# EasyEDA Pro project Orion S4 PCB.epro

# Board PCB1
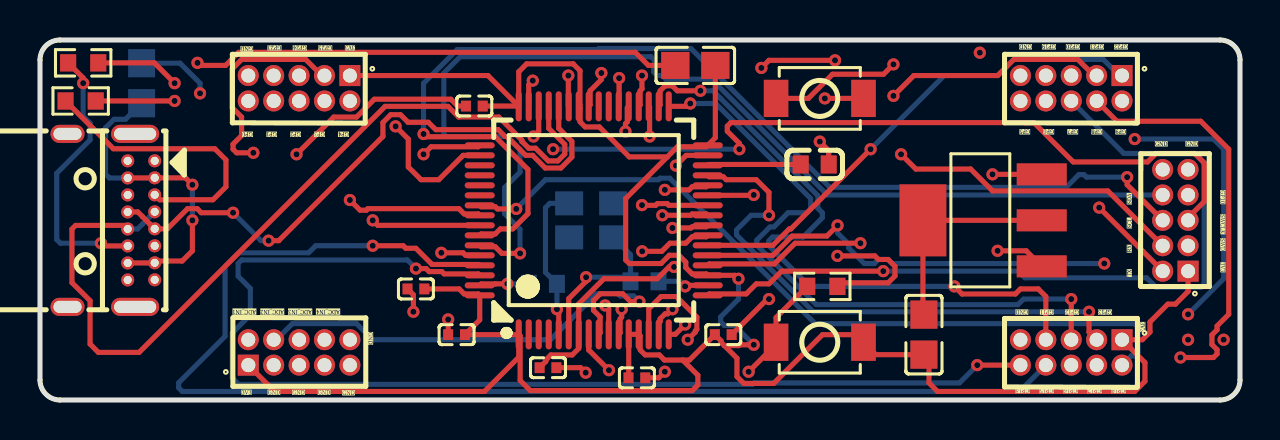
[diagram p0: board, top side]
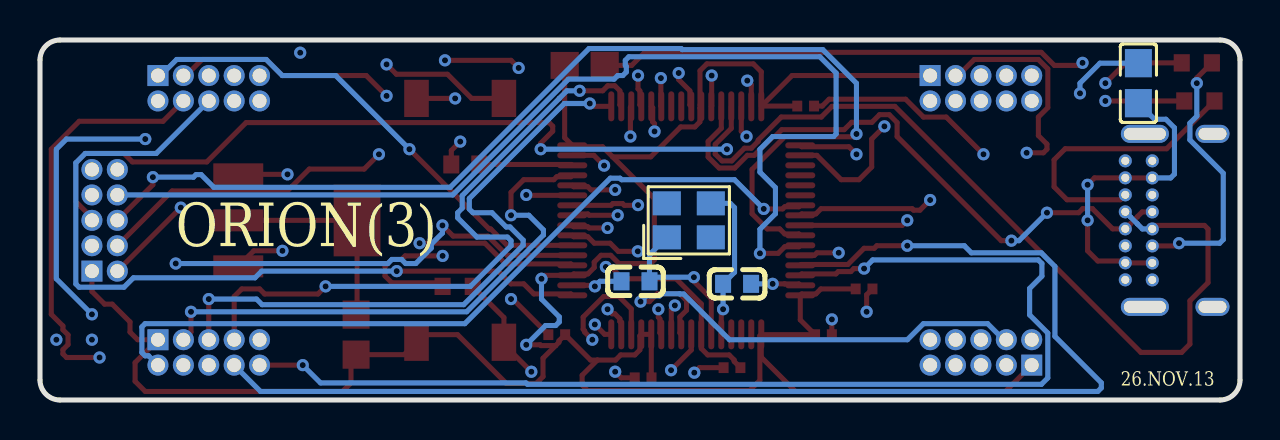
[diagram p1: board, bottom side, seen from below]

Outline 60 x 18 mm; copper layers: Top Layer, Inner1, Inner2, Inner3, Inner4, Bottom Layer. Coordinates in mm from the lower left corner of the outline.
Outline path: 0,17 0,1 arc(0.29,0.29) 1,0 59,0 arc(59.71,0.29) 60,1 60,17 arc(59.71,17.71) 59,18 1,18 arc(0.29,17.71) 0,17
Stack: Top Layer 0.035mm Outer layer thickness 1oz / Dielectric1 0.0994mm 3313 RC57% 4.2mil / Inner1 0.0152mm Inner layer thickness / Dielectric2 0.55mm 0.55mm H/H No copper / Inner2 0.0152mm Inner layer thickness / Dielectric3 0.1088mm 2116 RC54% 4.9mil / Inner3 0.0152mm Inner layer thickness / Dielectric4 0.55mm 0.55mm H/H No copper / Inner4 0.0152mm Inner layer thickness / Dielectric5 0.0994mm 3313 RC57% 4.2mil / Bottom Layer 0.035mm Outer layer thickness 1oz

## Design rules (mm)
spacing copperThickness1oz (default): track to track 0.102, other pairs 0.152 to 0.3
spacing copperThickness2oz: track to track 0.203, other pairs 0.152 to 0.3
track width copperThickness1oz (default): min 0.127, default 0.254, max 2.54
track width copperThickness2oz: min 0.203, default 0.254, max 2.54
differential pair differentialPair (default): width min 0.127, default 0.254, max 2.54; gap min 0.152, default 0.152
net GND uses copperRegion

## Placement (name value [footprint] x y rotation side)
C1  22pF  [C0603]  25.15 5.81 0 bottom
C2  22pF  [C0603]  30.23 5.94 180 bottom
C3  4.7nF  [C0603]  38.74 11.78 180 top
C4  100nF  [C0805]  32.77 16.73 180 top
C5  100nF  [C0402]  29.84 1.11 0 top
C6  100nF  [C0402]  21.72 14.7 0 top
C7  100nF  [C0402]  18.8 5.55 0 top
C8  100nF  [C0402]  34.16 3.27 180 top
C9  100nF  [C0402]  20.83 3.27 0 top
C10  10uF  [C0805]  5.08 15.84 270 bottom
C12  100nF  [C0402]  25.4 1.62 180 top
C14  10uF  [C0805]  44.2 3.27 270 top
R1  5.1kΩ  [R0603]  2.03 14.95 180 top
R2  5.1kΩ  [R0603]  2.16 16.86 0 top
R3  10kΩ  [R0603]  39.12 5.68 180 top
SW1  TS-1088-AR02016  [SW-SMD_L3.9-W3.0-P4.45]  38.99 2.89 0 top
SW2  TS-1088-AR02016  [SW-SMD_L3.9-W3.0-P4.45]  38.99 15.08 0 top
U1  STM32F401RET6  [LQFP-64_L10.0-W10.0-P0.50-LS12.0-BL]  27.69 8.98 0 top
U2  M50-3500542  [HDR-TH_10P-P1.27-V-M-R2-C5-S1.27-1]  51.56 15.59 180 top
U3  M50-3500542  [HDR-TH_10P-P1.27-V-M-R2-C5-S1.27-1]  12.95 15.59 180 top
U4  M50-3500542  [HDR-TH_10P-P1.27-V-M-R2-C5-S1.27-1]  12.95 2.38 0 top
U5  M50-3500542  [HDR-TH_10P-P1.27-V-M-R2-C5-S1.27-1]  56.77 8.98 90 top
U6  M50-3500542  [HDR-TH_10P-P1.27-V-M-R2-C5-S1.27-1]  51.56 2.38 180 top
U7  AMS1117-3.3  [SOT-223-3_L6.5-W3.4-P2.30-LS7.0-BR]  47.12 8.98 0 top
USB1  USB4085-GF-A  [USC-C-SMD_USB4085-GF-A]  3.56 8.98 270 top
X1  25MHz  [CRYSTAL-SMD_4P-L3.2-W2.5-BL]  27.56 8.98 180 bottom

## Footprints (pads in the part's own frame, mm; a bottom-side part is the same pattern mirrored in y, then rotated)
C0402
  rect 0.5x0.54 smd: 1(-0.42,0) 2(0.42,0)
C0603
  rect 0.8x0.9 smd: 1(-0.7,0) 2(0.7,0)
C0805
  rect 1.41x1.35 smd: 1(-1,0) 2(1,0)
CRYSTAL-SMD_4P-L3.2-W2.5-BL
  rect 1.4x1.2 smd: 1(-1.1,-0.85) 2(1.1,-0.85) 3(1.1,0.85) 4(-1.1,0.85)
HDR-TH_10P-P1.27-V-M-R2-C5-S1.27-1
  rect 1.05x1.05 hole 0.7: 1(-2.54,-0.635)
  round 1.05 hole 0.7: 2(-2.54,0.635) 3(-1.27,-0.635) 4(-1.27,0.635) 5(0,-0.635) 6(0,0.635) 7(1.27,-0.635) 8(1.27,0.635) 9(2.54,-0.635) 10(2.54,0.635)
LQFP-64_L10.0-W10.0-P0.50-LS12.0-BL
  oval 0.3x1.5 smd: 1(-3.75,-5.7) 2(-3.25,-5.7) 3(-2.75,-5.7) 4(-2.25,-5.7) 5(-1.75,-5.7) 6(-1.25,-5.7) 7(-0.75,-5.7) 8(-0.25,-5.7) 9(0.25,-5.7) 10(0.75,-5.7) 11(1.25,-5.7) 12(1.75,-5.7) 13(2.25,-5.7) 14(2.75,-5.7) 15(3.25,-5.7) 16(3.75,-5.7) 33(3.75,5.7) 34(3.25,5.7) 35(2.75,5.7) 36(2.25,5.7) 37(1.75,5.7) 38(1.25,5.7) 39(0.75,5.7) 40(0.25,5.7) 41(-0.25,5.7) 42(-0.75,5.7) 43(-1.25,5.7) 44(-1.75,5.7) 45(-2.25,5.7) 46(-2.75,5.7) 47(-3.25,5.7) 48(-3.75,5.7)
  oval 1.5x0.3 smd: 17(5.7,-3.75) 18(5.7,-3.25) 19(5.7,-2.75) 20(5.7,-2.25) 21(5.7,-1.75) 22(5.7,-1.25) 23(5.7,-0.75) 24(5.7,-0.25) 25(5.7,0.25) 26(5.7,0.75) 27(5.7,1.25) 28(5.7,1.75) 29(5.7,2.25) 30(5.7,2.75) 31(5.7,3.25) 32(5.7,3.75) 49(-5.7,3.75) 50(-5.7,3.25) 51(-5.7,2.75) 52(-5.7,2.25) 53(-5.7,1.75) 54(-5.7,1.25) 55(-5.7,0.75) 56(-5.7,0.25) 57(-5.7,-0.25) 58(-5.7,-0.75) 59(-5.7,-1.25) 60(-5.7,-1.75) 61(-5.7,-2.25) 62(-5.7,-2.75) 63(-5.7,-3.25) 64(-5.7,-3.75)
R0603
  rect 0.806x0.864 smd: 1(-0.753,0) 2(0.753,0)
SOT-223-3_L6.5-W3.4-P2.30-LS7.0-BR
  rect 2.5x1.1 smd: 1(2.97,-2.3) 2(2.97,0) 3(2.97,2.3)
  rect 2.34x3.6 smd: 4(-2.97,0)
SW-SMD_L3.9-W3.0-P4.45
  rect 1.23x1.86 smd: 1(-2.185,0) 2(2.185,0)
USC-C-SMD_USB4085-GF-A
  round 0.65 hole 0.4: A1(-2.975,2.18) A4(-2.125,2.18) A5(-1.275,2.18) A6(-0.425,2.18) A7(0.425,2.18) A8(1.275,2.18) A9(2.125,2.18) A12(2.975,2.18) B1(2.98,0.83) B4(2.13,0.83) B5(1.28,0.83) B6(0.43,0.83) B7(-0.42,0.83) B8(-1.27,0.83) B9(-2.12,0.83) B12(-2.975,0.83)
  oval 0.9x2.4 hole 0.6x2.1: S1(-4.325,1.2) S1(4.325,1.2)
  oval 0.9x1.7 hole 0.6x1.4: S1(-4.325,-2.18) S1(4.325,-2.18)

## Nets
3V3: C4.1 C5.1 C6.2 C7.2 C8.2 C9.2 C14.2 SW1.2 U1.1 U1.12 U1.13 U1.19 U1.32 U1.42 U1.48 U1.64 U3.1 U4.1 U5.1 U6.1
GND: C1.1 C2.1 C3.1 C4.2 C5.2 C6.1 C7.1 C8.1 C9.1 C10.1 C12.1 R1.1 R2.2 R3.1 SW2.1 U1.18 U1.31 U1.47 U1.63 U2.9 U3.9 U4.3 U4.5 U4.7 U4.9 U4.10 U5.9 U5.10 U6.9 U7.1 USB1.A1 USB1.A12 USB1.B1 USB1.B12 USB1.S1
VBUS: C10.2 U7.3 USB1.A4 USB1.A9 USB1.B4 USB1.B9
ADC1_IN1: U1.8 U4.2
ADC2_IN2: U1.9 U4.4
ADC3_IN3: U1.10 U4.6
ADC4_IN4: U1.11 U4.8
BOOT: R3.2 SW1.1 U1.60
CRYSTAL_IN: C1.2 U1.5 X1.3
CRYSTAL_OUT: C2.2 U1.6 X1.1
DN: U1.44 USB1.A7 USB1.B7
DP: U1.45 USB1.A6 USB1.B6
NRST: C12.2 SW2.2 U1.7
PA0: U1.14 U5.7
PA1: U1.15 U2.2
PA2: U1.16 U2.4
PA3: U1.17 U2.6
PA4: U1.20 U2.8
PA5: U1.21 U2.10
PA6: U1.22 U2.1
PA7: U1.23 U2.3
PA8: U1.41 U2.5
PA10: U1.43 U3.2
PA15: U1.50 U2.7
PB0: U1.26 U3.3
PB1: U1.27 U3.5
PB2: U1.28 U3.7
PB3: U1.55 U6.2
PB4: U1.56 U6.4
PB5: U1.57 U6.6
PB8: U1.61 U6.8
PB9: U1.62 U6.10
PB10: U1.29 U6.3
PB12: U1.33 U6.5
PB13: U1.34 U6.7
PB14: U1.35 U3.8
PB15: U1.36 U3.10
PC4: U1.24 U3.4
PC5: U1.25 U3.6
RX: U1.38 U5.4
SCL: U1.58 U5.6
SDA: U1.59 U5.8
SWCLK: U1.49 U5.5
SWD: U1.46 U5.3
TX: U1.37 U5.2
$1N19: R1.2 USB1.A5
$1N20: R2.1 USB1.B5
$1N166: C3.2 U1.30
$1N220: C14.1 U7.2 U7.4

Pads without a net: U1 2 3 4 39 40 51 52 53 54; USB1 A8 B8; X1 2 4

## Via types
v1: diameter 0.61, hole 0.305, Top Layer to Bottom Layer, 89 vias

## Routing (per net, layer and track width the routed paths; a pad name or vN(x,y) marks a point on that pad's centre or on a via; arc(x,y) is an arc through that point)
3V3: length 127.9
  Top Layer w0.254: C5.1 29.44,1.12 U1.12 U1.13 30.01,3.21 30.01,2.51 30.26,2.25 30.97,2.25 31.22,2 32.13,2 ; 32.13,2 32.89,1.24 32.89,0.75 32.62,0.47 24.51,0.47 24.01,0.98 24.01,3.21 U1.1 ; 32.13,2 32.47,2 33.74,3.27 34.05,2.96 34.05,2.88 34.22,2.72 ; U1.1 23.94,2.14 22.22,0.43 11.73,0.43 U4.1 ; U1.1 23.92,3.27 C9.2 21.99,4.01 U1.64 21.91,5.3 21.21,5.3 20.96,5.55 C7.2 ; 31.37,12.16 29.28,10.07 29.28,7 29.46,6.82 31.05,6.82 31.46,7.24 31.95,7.24 32.29,6.89 32.29,6.62 32.61,6.3 33.31,6.3 U1.19 34.75,6.23 v1(34.93,6.06) ; 31.37,12.16 29.46,12.16 27.97,13.65 27.26,13.65 27.01,13.91 27.01,14.61 U1.42 27,14.75 27,16.46 26.66,16.81 24.33,16.81 23.94,16.41 U1.48 ; 31.37,12.16 31.87,12.66 33.31,12.66 U1.32 33.77,13.11 C4.1 ; 34.22,2.72 34.95,2.72 34.99,2.76 v1(35.69,2.76) ; 34.22,2.72 34.85,2.09 34.85,1.17 35.19,0.83 36.69,0.83 39.12,3.27 40.79,3.27 SW1.2 41.79,2.27 C14.2 44.45,2.01 44.45,0.86 44.88,0.43 54.74,0.43 55.25,0.93 55.25,1.87 U6.1 55.12,3.01 55.5,3.39 55.5,3.9 56.39,4.79 56.77,4.79 57.4,5.43 U5.1 ; U3.1 22.4,16.22 23.92,14.7 C6.2
  Bottom Layer w0.254: v1(35.69,2.76) 34.72,3.72 34.22,3.72 34.04,3.9 34.04,4.16 34.93,5.05 v1(34.93,6.06)
GND: length 105.7
  Top Layer w0.254: v1(42.67,16.78) 42.18,16.29 39.63,16.29 38.42,15.08 SW2.1 ; U1.47 24.44,15.77 v1(24.64,15.97) ; v1(39.87,7.2) 41.74,7.2 41.92,7.03 42.41,7.03 42.75,6.69 42.75,6.2 42.41,5.86 40.05,5.86 R3.1 ; C7.1 18.67,5.26 v1(18.67,4.41) ; R2.2 5.72,16.86 v1(6.73,15.84) ; U1.31 32.31,12.23 v1(31.8,11.72) ; U7.1 49.31,7.46 v1(47.88,7.46) ; v1(36.45,5.05) 36.36,5.05 C8.1 ; C5.2 30.94,1.11 v1(31.24,1.41) ; v1(27.29,1.37) 27.03,1.62 C12.1 ; v1(38.99,12.92) 39.44,12.47 C3.1 ; v1(23.37,5.81) 22.77,5.81 22.76,5.8 22.06,5.8 U1.63 ; v1(12.83,12.28) 14.69,14.15 15.83,14.15 16.72,15.04 20.54,15.04 20.89,14.7 C6.1 ; R1.1 v1(6.73,14.95) ; U1.18 32.31,5.73 v1(32.26,5.68) ; v1(7.87,16.86) 8,16.73 9.28,16.73 9.93,17.38 29.76,17.38 30.42,16.73 C4.2 ; C9.1 v1(20.41,4.03)
  Inner4 w0.254: v1(12.83,12.28) 12.45,11.9 12.32,11.9 ; v1(39.87,7.2) 39.12,7.2 ; v1(18.67,4.41) 18.67,3.78 ; 47.5,3.14 48.9,3.14 U6.9 ; 1.38,13.31 2.42,13.31 3.05,13.94 ; v1(27.29,1.37) 27.03,1.11 26.67,1.11 ; v1(6.73,15.84) 7.37,15.84 ; 4.83,3.27 4.83,4.59 USB1.S1 ; USB1.S1 1.4,4.64 1.4,3.27 ; v1(8,15.33) 8,14.7 ; 4.76,13.31 6.48,13.31 6.6,13.43 ; v1(6.73,14.95) 7.37,14.95 ; v1(47.88,7.46) 47.12,7.46 ; U4.10 16.76,3.01 ; U2.9 47.88,16.22 ; U5.10 56.13,12.79 ; 20.41,4.66 v1(20.41,4.03) ; v1(42.67,16.78) 43.31,16.78 ; v1(7.87,16.86) 7.11,16.86 ; 31.88,1.41 v1(31.24,1.41) ; v1(38.99,12.92) 38.99,13.55
  Inner4 w0.5: v1(36.45,5.05) 36.91,5.51 36.91,5.76 36.73,5.94 36.45,5.94 35.69,5.17 32.77,5.17 v1(32.26,5.68)
  Bottom Layer w0.254: v1(8,15.33) 8,15.84 7,16.84 C10.1 ; C2.1 32,5.94 v1(32.26,5.68) ; C1.1 v1(23.37,5.81)
VBUS: length 60.4
  Top Layer w0.254: USB1.B9 5.73,11.1 USB1.A4 7.27,11.11 v1(7.62,10.76) ; USB1.B4 5.73,6.85 USB1.A9 5.83,6.95 7.11,6.95 7.62,7.46 v1(7.62,8.98) ; U7.3 v1(47.62,11.28)
  Inner1 w0.254: USB1.A4 5.75,11.09 47.43,11.09 v1(47.62,11.28)
  Bottom Layer w0.254: C10.2 4.28,14.04 3.7,14.04 3.28,13.61 3.28,11.29 3.47,11.1 USB1.B9 ; v1(7.62,10.76) v1(7.62,8.98)
ADC1_IN1: length 23.3
  Top Layer w0.254: U1.8 27.44,2.5 v1(28.45,1.49)
  Inner1 w0.254: U4.2 11.81,4.41 16.38,4.41 17.15,3.65 17.15,2.51 18.87,0.78 27.74,0.78 v1(28.45,1.49)
ADC2_IN2: length 24.5
  Top Layer w0.254: v1(29.97,4.92) 29.53,4.92 29.13,5.31 28.02,5.31 27.67,4.97 27.67,4.49 28.01,4.15 28.01,3.35 U1.9
  Bottom Layer w0.254: v1(29.97,4.92) 29.69,5.21 29.01,5.21 28.9,5.31 28.02,5.31 28,5.3 27.81,5.3 25.53,3.01 16.63,3.01 15.83,3.82 12.62,3.82 11.82,3.01 U4.4
ADC3_IN3: length 22.8
  Top Layer w0.254: v1(28.26,4.73) 28.44,4.55 U1.10
  Inner2 w0.254: U4.6 14.73,4.79 16.38,4.79 17.4,3.78 17.4,2.63 18.52,1.51 26.56,1.51 27.37,2.33 28.36,2.33 28.36,2.6 27.81,3.14 27.81,4.28 v1(28.26,4.73)
ADC4_IN4: length 40.3
  Top Layer w0.254: U1.11 29.01,3.35 29.01,4.06 29.08,4.14 v1(29.08,4.54)
  Inner2 w0.254: v1(29.08,4.54) 28.84,4.78 28.84,4.97 28.5,5.31 28.02,5.31 27.67,4.97 27.67,4.65 27.46,4.43 27.46,2.91 26.41,1.87 18.67,1.87 17.83,2.71 17.83,3.85 16.51,5.17 11.44,5.17 9.61,3.35 9.61,1.1 9.77,0.94 15.83,0.94 16.3,1.41 16.3,3.35 15.83,3.82 15.03,3.82 U4.8
BOOT: length 25.3
  Top Layer w0.254: v1(20.07,7.36) 21.15,7.36 21.28,7.23 U1.60 ; R3.2 36.8,4.12 SW1.1 36.8,2.78 v1(35.43,1.41)
  Inner1 w0.254: v1(35.43,1.41) 34.59,2.25 25.17,2.25 v1(20.07,7.36)
CRYSTAL_IN: length 7.9
  Top Layer w0.254: v1(25.85,4.54) 25.94,4.45 U1.5
  Bottom Layer w0.254: X1.3 25.49,9.83 25.27,9.62 25.27,6.38 C1.2 v1(25.85,4.54)
CRYSTAL_OUT: length 8.1
  Top Layer w0.254: v1(27.31,6.14) 27.31,5.94 26.44,5.07 U1.6
  Bottom Layer w0.254: X1.1 29.53,7.27 C2.2 29.32,6.14 v1(27.31,6.14)
DN: length 30.8
  Top Layer w0.254: U1.44 25.94,13.59 26.59,12.93 26.59,12.15 26.04,11.6 25.26,11.6 24.63,12.23 24.29,12.23 23.35,13.17 23.25,13.17 22.91,13.52 19.79,13.52 19.42,13.88 18.4,13.88 18.02,14.27 17.54,14.27 17.15,13.87 17.15,13.17 11.94,7.97 v1(11.43,7.97) ; v1(9.65,9.36) 8.06,9.36 7.86,9.57 7.38,9.57 6.37,8.56 USB1.A7 5.49,8.8 5.49,8.8 5.13,9.16 5.13,9.16 4.89,9.4 USB1.B7
  Bottom Layer w0.254: v1(9.65,9.36) 11.05,7.97 v1(11.43,7.97)
DP: length 43.8
  Top Layer w0.254: USB1.B6 4.21,8.73 1.78,8.73 1.6,8.55 1.6,5.87 2.5,4.96 2.5,2.8 2.92,2.38 4.95,2.38 17.26,14.68 20.4,14.68 20.93,14.15 22.94,14.15 24.09,12.99 24.09,12.93 24.43,12.59 24.78,12.59 25.41,11.95 25.9,11.95 26.24,12.3 26.24,12.78 25.44,13.58 U1.45
  Bottom Layer w0.254: USB1.B6 4.88,8.55 5.13,8.8 5.13,8.81 5.49,9.16 5.49,9.16 USB1.A6
NRST: length 23.6
  Top Layer w0.254: v1(31.71,6.65) 31.45,6.65 30.86,6.06 28.19,6.06 26.94,4.8 U1.7 26.94,2.58 26.61,2.25 25.54,2.25 25.29,2 25.29,1.93 C12.2 ; SW2.2 v1(39.24,15.08)
  Inner2 w0.254: v1(39.24,15.08) 32.92,8.75 32.92,8.06 31.71,6.85 v1(31.71,6.65)
PA0: length 43.5
  Top Layer w0.254: v1(32.38,3.01) 32.77,3.39 32.77,3.46 32.84,3.53 32.84,4.14 31.81,5.17 31.05,5.17 30.44,4.56 U1.14
  Inner3 w0.254: U5.7 58.56,9.09 58.56,5.66 58.29,5.38 58.29,1.62 58.8,1.11 58.8,0.86 58.37,0.43 34.97,0.43 v1(32.38,3.01)
PA1: length 45.5
  Top Layer w0.254: U1.15 30.94,3.85 31.01,3.92 31.01,4.06 31.26,4.31 31.4,4.31 v1(31.62,4.54)
  Inner1 w0.254: v1(59.18,3.01) v1(57.4,3.01)
  Inner3 w0.254: U2.2 56.73,12.33 57.74,12.33 58.21,11.86 58.21,10.85 59.18,9.87 v1(59.18,3.01) ; v1(57.4,3.01) 54.79,5.63 51.32,5.63 50.05,4.36 31.8,4.36 v1(31.62,4.54)
PA2: length 48.3
  Top Layer w0.254: v1(32.26,3.78) 31.76,3.28 U1.16 ; U2.4 53.85,13.94 58.04,13.94 59.44,12.54 59.44,4.28 58.85,3.7 58.85,3.51 58.6,3.26 58.6,2.77 58.85,2.52 58.85,2.3 58.67,2.12 v1(57.02,2.12)
  Inner2 w0.254: v1(57.02,2.12) 57.02,2.57 56.82,2.77 56.82,2.96 54.48,5.3 54.23,5.3 52.75,3.82 48.69,3.82 48.65,3.78 v1(32.26,3.78)
PA3: length 39.7
  Top Layer w0.254: v1(42.16,6.44) 37.08,6.44 36.45,5.81 35.81,5.81 35.31,5.3 33.46,5.3 U1.17
  Bottom Layer w0.254: v1(42.16,6.44) 48.92,6.44 49.25,6.11 55.33,6.11 55.8,5.64 58.04,5.64 58.21,5.8 58.21,11.86 57.74,12.33 54.19,12.33 U2.6
PA4: length 45
  Top Layer w0.254: U1.20 33.46,6.8 36.72,6.8 37.76,7.84 v1(41.02,7.84)
  Inner3 w0.254: v1(54.74,13.05) 52.2,13.05 U2.8 ; v1(41.02,7.84) 41.28,8.09 52.84,8.09 55.65,5.28 56.41,5.28 v1(57.4,4.28)
  Bottom Layer w0.254: v1(54.74,13.05) 58.67,13.05 59.18,12.54 59.18,6.06 v1(57.4,4.28)
PA5: length 31.9
  Top Layer w0.254: U1.21 36.65,7.23 37.61,8.2 39.34,8.2 v1(39.88,8.73)
  Inner1 w0.254: U2.10 49.02,14.38 53.54,9.86 53.54,7.18 53.21,6.85 v1(53.21,6.82)
  Bottom Layer w0.254: v1(53.21,6.82) 42.61,6.82 42.41,7.03 41.92,7.03 41.72,6.82 41.21,6.82 40.44,7.6 40.44,7.79 39.88,8.35 v1(39.88,8.73)
PA6: length 24.9
  Top Layer w0.254: v1(41.53,12.54) 37.54,8.55 37.46,8.55 36.64,7.73 U1.22
  Bottom Layer w0.254: U2.1 53.97,16.22 53.16,17.03 48.69,17.03 47.88,16.22 45.21,16.22 v1(41.53,12.54)
PA7: length 31
  Top Layer w0.254: U2.3 52.7,16.22 51.9,17.03 48.69,17.03 47.88,16.22 43.69,16.22 v1(42.67,15.21) ; v1(30.11,7.43) 31.09,7.43 31.5,7.84 32.29,7.84 32.61,8.16 33.31,8.16 U1.23
  Inner3 w0.254: v1(42.67,15.21) 37.03,9.57 37.03,9 36.69,8.65 36.12,8.65 35.69,8.22 32.07,8.22 31.87,8.02 30.69,8.02 v1(30.11,7.43)
PA8: length 27.3
  Top Layer w0.254: v1(28.07,16.35) 28.07,16.02 27.51,15.46 27.51,14.75 U1.41
  Inner2 w0.254: v1(46.99,17.36) 40.2,17.36 39.99,17.57 32.27,17.57 30.21,15.51 28.71,15.51 28.37,15.85 28.37,16.04 v1(28.07,16.35)
  Inner3 w0.254: U2.5 51.43,16.22 50.62,17.03 47.33,17.03 v1(46.99,17.36)
PA10: length 13.4
  Top Layer w0.254: U1.43 26.42,14.7 v1(26.42,16.22)
  Inner1 w0.254: v1(26.42,16.22) 25.97,16.67 21.53,16.67 19.81,14.95 U3.2
PA15: length 42.3
  Top Layer w0.254: U1.50 21.16,12.23 19.94,11.02 19.05,11.02 18.41,11.65 18.41,13.05 v1(17.78,13.68)
  Inner2 w0.254: v1(17.78,13.68) 20.73,16.63 25.18,16.63 26.66,15.16 30.36,15.16 31.43,16.22 35.62,16.22 35.83,16.02 47.68,16.02 48.69,17.03 49.35,17.03 50.16,16.22 U2.7
PB0: length 44.6
  Top Layer w0.254: v1(30.1,9.75) 30.11,9.73 30.78,9.73 30.87,9.82 31.36,9.82 31.44,9.73 U1.26 ; U3.3 14.09,16.22 13.29,17.03 10.08,17.03 9.61,16.55 9.61,14.62 10.08,14.15 10.08,13.22 9.65,12.79 9.65,12.54 9.83,12.36 v1(10.67,12.36)
  Inner2 w0.254: v1(10.67,12.36) 13.61,9.41 15.74,9.41 16.07,9.75 16.77,9.75 19.77,6.75 30.98,6.75 31.89,7.66 32.01,7.66 32.56,8.21 32.56,10.01 31.48,11.09 31,11.09 30.1,10.19 v1(30.1,9.75)
PB1: length 56.5
  Top Layer w0.254: v1(35.69,10.25) 35.67,10.23 U1.27
  Inner1 w0.254: U3.5 13.09,16.22 13.89,17.03 26.44,17.03 27,16.46 27,14.62 29.21,12.41 29.31,12.41 29.9,13 29.9,13.42 30.24,13.76 30.72,13.76 31.06,13.42 31.06,13 31.71,12.36 32.25,12.36 33.16,11.45 46.96,11.45 47.38,11.87 47.87,11.87 48.21,11.52 48.21,11.04 47.42,10.25 v1(35.69,10.25)
PB2: length 28
  Top Layer w0.254: U1.28 33.31,10.66 32.61,10.66 32.45,10.51 v1(31.24,10.51)
  Inner3 w0.254: v1(31.24,10.51) 31.24,10.58 31.06,10.76 17.15,10.76 16.3,11.61 16.3,16.86 16.13,17.03 12.62,17.03 11.82,16.22 U3.7
PB3: length 39.1
  Top Layer w0.254: v1(23.81,9.55) 22.87,9.55 22.76,9.66 22.06,9.66 U1.55
  Bottom Layer w0.254: U6.2 54.57,2.21 54.74,2.21 54.91,2.37 54.91,3.65 54.74,3.82 38.76,3.82 31.48,11.09 31,11.09 30.92,11.02 25.27,11.02 v1(23.81,9.55)
PB4: length 59.1
  Top Layer w0.254: U1.56 21.91,9.3 21.21,9.3 20.94,9.57 16.4,9.57 16.32,9.49 16,9.49 v1(15.49,10)
  Inner1 w0.254: v1(15.49,10) 23.43,10 23.57,10.14 24.05,10.14 26.18,8.02 33.79,8.02 35.44,9.67 35.93,9.67 36.16,9.9 47.57,9.9 47.67,10 48.01,10 53.47,4.54 55.63,4.54 56.19,3.98 56.19,0.65 56.01,0.47 54.1,0.47 U6.4
PB5: length 67.4
  Top Layer w0.254: v1(16.64,8.98) 16.89,8.73 U1.57
  Inner1 w0.254: U6.6 50.24,0.43 6.35,0.43 6.17,0.61 6.17,0.86 8.73,3.42 8.73,6.67 11.05,8.98 v1(16.64,8.98)
PB8: length 64.6
  Top Layer w0.254: v1(16.64,7.71) 18.16,7.71 18.29,7.59 18.8,7.59 19.61,6.78 21.94,6.78 U1.61
  Bottom Layer w0.254: v1(16.64,7.71) 13.78,7.71 13.43,7.36 9.94,7.36 9.25,6.68 9.25,3.18 6.93,0.86 6.93,0.61 7.11,0.43 48.97,0.43 U6.8
PB9: length 58.8
  Top Layer w0.254: U1.62 21.91,6.3 20.21,6.3 20.09,6.42 19.46,6.42 19.31,6.57 v1(18.8,6.57) ; U6.10 v1(46.86,1.74)
  Bottom Layer w0.254: v1(46.86,1.74) 45.97,0.86 35.7,0.86 35.63,0.78 9.93,0.78 9.61,1.1 9.61,3.35 10.52,4.26 10.52,5.58 9.91,6.19 9.91,6.82 10.09,7 18.36,7 v1(18.8,6.57)
PB10: length 27.5
  Top Layer w0.254: v1(52.45,4.41) 52.45,3.39 U6.3 ; U1.29 33.46,11.16 34.16,11.16 34.31,11.02 35.81,11.02 36.45,10.38 v1(36.45,9.24)
  Bottom Layer w0.254: v1(52.45,4.41) 38.67,4.41 34.83,8.25 34.83,8.5 35.56,9.24 v1(36.45,9.24)
PB12: length 32.3
  Top Layer w0.254: v1(32.51,14.83) 32.37,14.68 U1.33 ; U6.5 v1(51.56,5.05)
  Bottom Layer w0.254: v1(51.56,5.05) 49.17,5.05 48.9,4.77 38.81,4.77 35.84,7.74 35.84,7.99 36.5,8.65 36.69,8.65 37.4,9.36 38.35,9.36 38.53,9.54 38.53,10.07 33.78,14.83 v1(32.51,14.83)
PB13: length 32.9
  Top Layer w0.254: U6.7 50.29,5.17 49.91,5.55 49.02,5.55 48.77,5.3 46.1,5.3 v1(45.72,5.68) ; U1.34 31.01,14.75 31.01,15.46 31.26,15.71 31.61,15.71 31.87,15.46 v1(33.02,15.46)
  Bottom Layer w0.254: v1(33.02,15.46) 33.66,15.46 34.04,15.08 34.04,15.07 38.89,10.22 38.89,9.59 39.12,9.36 39.12,9.11 38.15,8.15 36.63,8.15 36.45,7.97 36.45,7.71 38.48,5.68 v1(45.72,5.68)
PB14: length 22.6
  Top Layer w0.254: U1.35 30.48,14.64 v1(30.48,13.17)
  Inner1 w0.254: v1(30.48,13.17) 30.48,12.66 29.46,11.64 15,11.64 U3.8
PB15: length 24.6
  Top Layer w0.254: v1(30.1,16.22) 30.1,15.55 30.01,15.46 30.01,14.75 U1.36
  Inner2 w0.254: U3.10 10.41,15.08 9.61,15.89 9.61,16.55 10.08,17.03 16.13,17.03 16.18,16.98 29.34,16.98 v1(30.1,16.22)
PC4: length 22.8
  Top Layer w0.254: v1(31.62,8.6) 32.55,8.6 32.61,8.66 33.31,8.66 U1.24
  Inner2 w0.254: v1(31.62,8.6) 18.92,8.6 18.16,9.36 18.16,11.02 U3.4
PC5: length 26.9
  Top Layer w0.254: U1.25 33.31,9.3 32.61,9.3 32.54,9.24 v1(31.12,9.24)
  Inner2 w0.254: v1(31.12,9.24) 31.81,9.24 32.21,8.84 32.21,8.36 31.87,8.02 19,8.02 17.81,9.22 17.81,10.1 U3.6
RX: length 33.2
  Top Layer w0.254: v1(28.96,16.09) 28.96,14.7 U1.38 ; v1(43.05,12.28) 43.79,11.55 46.53,11.55 47.63,10.45 53.39,10.45 U5.4
  Inner1 w0.254: v1(28.96,16.09) 30.35,17.49 37.85,17.49 v1(43.05,12.28)
SCL: length 55.5
  Top Layer w0.254: U1.58 22.06,8.3 22.76,8.3 23.01,8.55 23.64,8.55 24.4,9.31 24.4,11.53 22.76,13.16 19.32,13.16 v1(19.18,13.3) ; v1(54.36,11.14) 54.36,10.76 U5.6
  Bottom Layer w0.254: v1(19.18,13.3) 19.18,15.84 20.86,17.52 27.89,17.52 27.94,17.57 32.55,17.57 39.49,10.63 51.31,10.63 51.94,11.27 52.2,11.27 52.32,11.14 v1(54.36,11.14)
SDA: length 54.8
  Top Layer w0.254: U1.59 22.06,7.66 22.76,7.66 23.09,7.33 v1(24,7.33)
  Bottom Layer w0.254: v1(24,7.33) 24,8.54 23.23,9.31 23.23,10.62 24,11.39 24,12.54 23.37,13.17 20.32,13.17 20.19,13.3 20.19,16.35 21.01,17.16 30.55,17.16 30.73,16.98 30.73,16.73 30.68,16.68 30.68,16.4 30.86,16.22 31.12,16.22 31.29,16.04 33.57,16.04 39.37,10.25 U5.8
SWCLK: length 48.6
  Top Layer w0.254: v1(34.97,12.54) 34.97,12.83 34.36,13.44 34.36,13.69 34.54,13.87 49.69,13.87 51.66,11.9 55.38,11.9 55.8,12.33 57.74,12.33 58.21,11.86 58.21,9.92 57.4,9.12 U5.5 ; v1(19.18,12.28) 19.55,12.66 21.91,12.66 U1.49
  Inner1 w0.254: v1(19.18,12.28) 25.4,12.28 v1(25.65,12.54)
  Bottom Layer w0.254: v1(34.97,12.54) v1(25.65,12.54)
SWD: length 50
  Top Layer w0.254: v1(24.68,13.17) 24.94,13.43 U1.46
  Inner3 w0.254: U5.3 57.58,7.71 58.21,7.08 58.21,5.8 58.04,5.64 55.8,5.64 43.87,17.57 24.76,17.57 24.59,17.39 24.59,17.14 26.42,15.31 26.42,13.05 26.36,13 26.02,13 25.9,13.12 25.41,13.12 25.16,12.87 24.76,12.87 24.68,12.96 v1(24.68,13.17)
TX: length 38.2
  Top Layer w0.254: v1(36.07,16.6) 36.45,16.98 v1(39.75,16.98) ; v1(29.27,13.43) 29.27,13.81 29.37,13.91 29.37,14.61 U1.37 ; U5.2 v1(52.96,9.62)
  Inner1 w0.254: v1(52.96,9.62) 45,17.57 40.34,17.57 v1(39.75,16.98)
  Inner3 w0.254: v1(29.27,13.43) 29.27,13.11 30.02,12.36 31.06,12.36 31.24,12.54 31.24,12.79 31.06,12.97 31.06,16.08 30.98,16.17 30.98,16.42 31.16,16.6 v1(36.07,16.6)
$1N19: length 14.5
  Top Layer w0.254: R1.2 3.67,12.56 8.74,12.56 9.3,12.01 9.3,10.66 8.65,10.01 5.98,10.01 USB1.A5
$1N20: length 13.7
  Top Layer w0.254: v1(3.05,7.84) 3.19,7.7 USB1.B5 ; v1(2.16,15.84) 2.16,16.1 R2.1
  Bottom Layer w0.254: v1(2.16,15.84) 2.16,14.19 2.5,13.84 2.5,13.01 0.84,11.34 0.84,8.02 1.02,7.84 v1(3.05,7.84)
$1N166: length 4.7
  Top Layer w0.254: 38.03,11.78 33.43,11.78 U1.30
$1N220: length 10.7
  Top Layer w0.254: C14.1 44.15,4.32 U7.4 U7.2

## Copper pours and planes (outline as drawn; the poured copper is in the pictures)
GND on Inner4: -0.25,18.13 60.07,18.13 60.07,-0.16 -0.25,-0.16

## Text on the board
Bottom Silkscreen Layer: 26.NOV.13 | ORION(3)
Top Silkscreen Layer: 3V3 | GND | SDA | SCL | RX | TX | GP0 | ADC_IN1 | GP1 | GP23 | ADC_IN2 | GP2 | GP24 | ADC_IN3 | GP3 | GP25 | ADC_IN4 | GP4 | GP14 | GP5 | GP15 | GP11 | GP6 | GP19 | GP16 | GP7 | GP12 | GP20 | GP17 | GP8 | GP21 | GP13 | GP18 | GP9 | GP22 | GP10 | SWCLK | SWD
